# Altium schematic sheet Bluetooth_SOC.SchDoc
size 420 x 297 mm; SheetNumber: 2; SheetTotal: 3
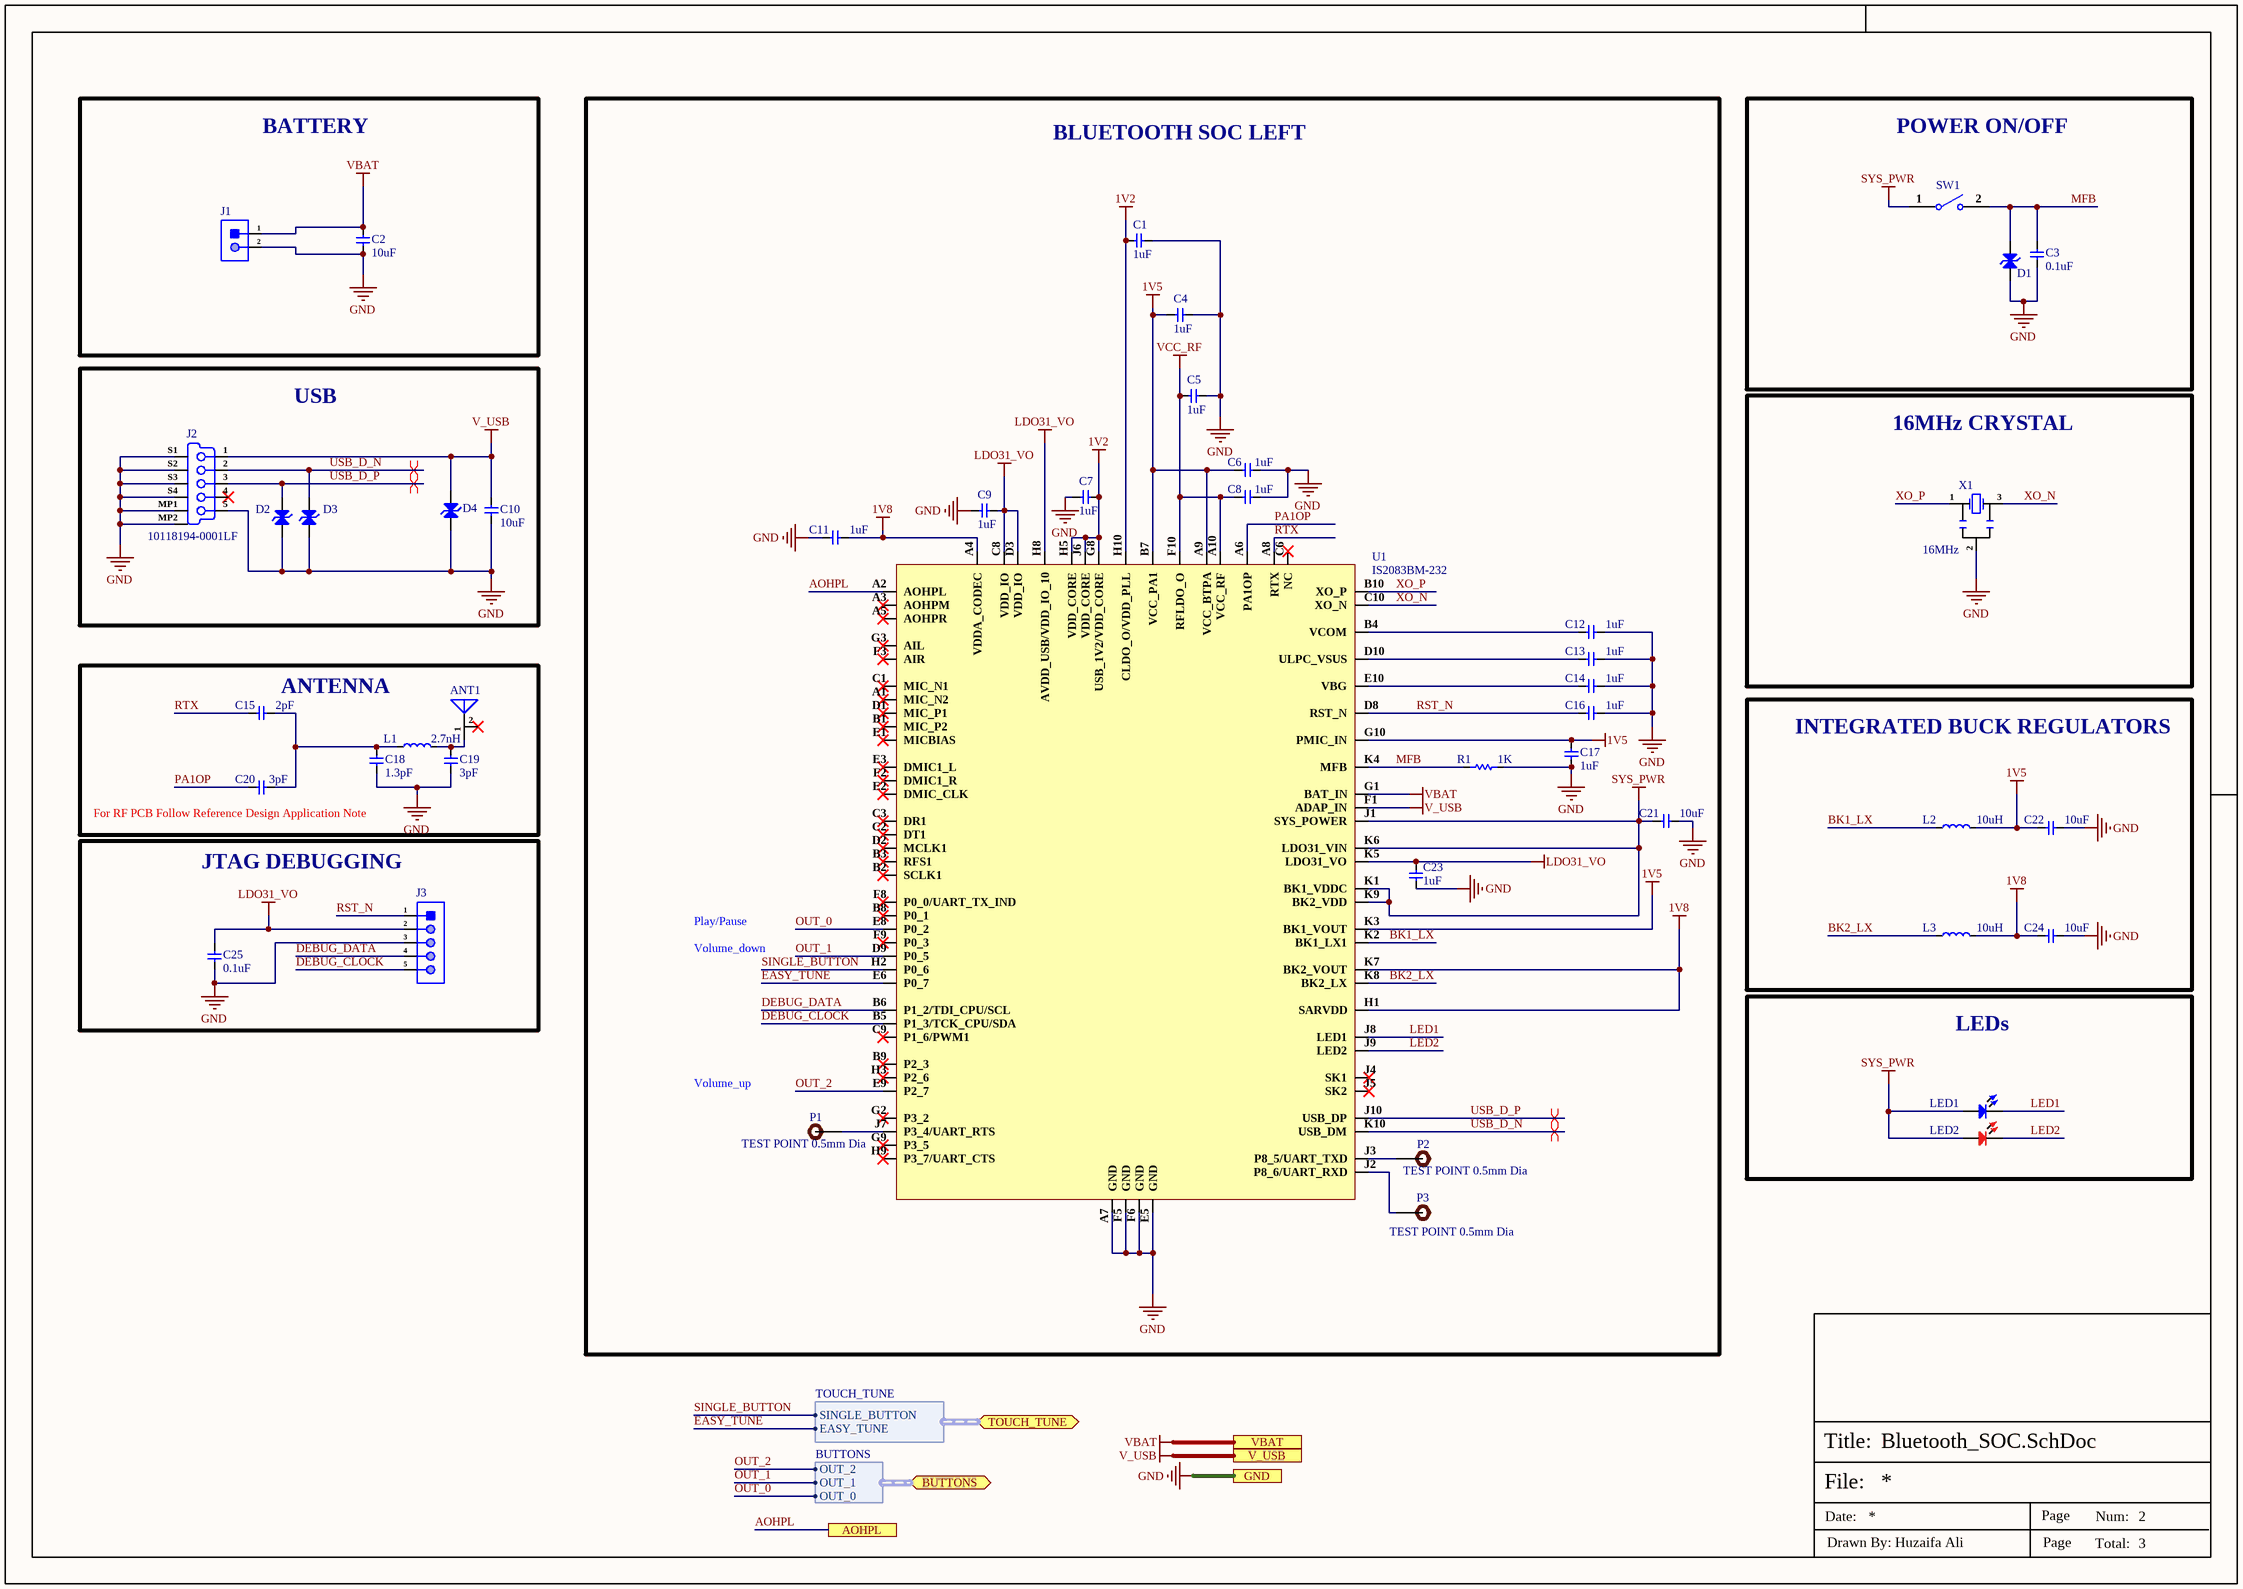
[diagram p0: Bluetooth_SOC.SchDoc]

## Parts
ANT1  ANT3216LL00R2400A  [ANT3216LL00R2400A]  (value not drawn)
C1  1uF  [Cap-0201]
C2  10uF  [Cap-0402]
C3  0.1uF  [CAP-0201]
C4  1uF  [Cap-0201]
C5  1uF  [Cap-0201]
C6  1uF  [Cap-0201]
C7  1uF  [Cap-0201]
C8  1uF  [Cap-0201]
C9  1uF  [Cap-0201]
C10  10uF  [Cap-0402]
C11  1uF  [Cap-0201]
C12  1uF  [Cap-0201]
C13  1uF  [Cap-0201]
C14  1uF  [Cap-0201]
C15  2pF  [CAP-0201]
C16  1uF  [Cap-0201]
C17  1uF  [Cap-0201]
C18  1.3pF  [CAP-0201]
C19  3pF  [CAP-0201]
C20  3pF  [CAP-0201]
C21  10uF  [Cap-0402]
C22  10uF  [Cap-0402]
C23  1uF  [Cap-0201]
C24  10uF  [Cap-0402]
C25  0.1uF  [CAP-0201]
D1  PESD5V0H1BSFYL  [DSN0603-2]  (value not drawn)
D2  PESD5V0H1BSFYL  [DSN0603-2]  (value not drawn)
D3  PESD5V0H1BSFYL  [DSN0603-2]  (value not drawn)
D4  PESD5V0H1BSFYL  [DSN0603-2]  (value not drawn)
J1  2 Test Pad  [2 Test Pad]  (value not drawn)
J2  10118194-0001LF  [10118194-0001LF_]
J3  5 Test Pad  [5 Test Pad]  (value not drawn)
L1  2.7nH  [IND-0201]
L2  10uH  [IND-0603 (1608 Metric)]
L3  10uH  [IND-0603 (1608 Metric)]
LED1  Blue  [LED-0603]  (value not drawn)
LED2  RED  [LED-0603]  (value not drawn)
P1  TEST POINT 0.5mm Dia  [Test-point - 0.5mm]
P2  TEST POINT 0.5mm Dia  [Test-point - 0.5mm]
P3  TEST POINT 0.5mm Dia  [Test-point - 0.5mm]
R1  1K  [Res-0201]
SW1  B3U-1000P  [B3U-1000P]  (value not drawn)
U1  IS2083BM-232  [82-VFBGA]
X1  16MHz  [SMD3213-3P]

## Blocks framed on the sheet
BATTERY: C2 J1
BLUETOOTH SOC LEFT: C1 C4-C9 C11-C14 C16 C17 C21 C23 P1-P3 R1 U1
POWER ON/OFF: C3 D1 SW1
USB: C10 D2-D4 J2
16MHz CRYSTAL: X1
ANTENNA: ANT1 C15 C18-C20 L1
INTEGRATED BUCK REGULATORS: C22 C24 L2 L3
JTAG DEBUGGING: C25 J3
LEDs: LED1 LED2

## Ports
AOHPL, BUTTONS (bidir, harness BUTTONS), GND, TOUCH_TUNE (bidir, harness TOUCH_TUNE), V_USB, VBAT

## Harnesses
BUTTONS: OUT_2, OUT_1, OUT_0
TOUCH_TUNE: SINGLE_BUTTON, EASY_TUNE

## Nets
1V2: C1.1 C7.1 U1.G8(USB_1V2/VDD_CORE) U1.H5(VDD_CORE) U1.H10(CLDO_O/VDD_PLL) U1.J6(VDD_CORE)
1V5: C4.2 C6.2 C17.2 C22.2 L2.2 U1.A9(VCC_BTPA) U1.B7(VCC_PA1) U1.G10(PMIC_IN) U1.K3(BK1_VOUT)
1V8: C11.2 C24.2 L3.2 U1.A4(VDDA_CODEC) U1.H1(SARVDD) U1.K7(BK2_VOUT)
GND: C1.2 C2.2 C3.1 C4.1 C5.1 C6.1 C7.2 C8.1 C9.2 C10.2 C11.1 C12.2 C13.2 C14.2 C16.2 C17.1 C18.1 C19.1 C21.1 C22.1 C23.1 C24.1 C25.1 D1.1(A) D2.1(A) D3.1(A) D4.1(A) J1.2 J2.5(GND) J2.MP1(Tab) J2.MP2(Tab) J2.S1(Shield) J2.S2(Shield) J2.S3(Shield) J2.S4(Shield) J3.3 R1.2 U1.A7(GND) U1.E5(GND) U1.F5(GND) U1.F6(GND) X1.2 ; port GND
LDO31_VO: C9.1 C23.2 C25.2 J3.2 U1.C8(VDD_IO) U1.D3(VDD_IO) U1.H8(AVDD_USB/VDD_IO_10) U1.K5(LDO31_VO)
SYS_PWR: C21.2 LED1.1 LED2.1 SW1.1 U1.J1(SYS_POWER) U1.K1(BK1_VDDC) U1.K6(LDO31_VIN) U1.K9(BK2_VDD)
V_USB: C10.1 D4.2(A) J2.1(V_BUS_(5V)) U1.F1(ADAP_IN) ; port V_USB
VBAT: C2.1 J1.1 U1.G1(BAT_IN) ; port VBAT
VCC_RF: C5.2 C8.2 U1.A10(VCC_RF) U1.F10(RFLDO_O)
AOHPL: U1.A2(AOHPL) ; port AOHPL
BK1_LX: L2.1 U1.K2(BK1_LX1)
BK2_LX: L3.1 U1.K8(BK2_LX)
DEBUG_CLOCK: J3.5 U1.B5(P1_3/TCK_CPU/SDA)
DEBUG_DATA: J3.4 U1.B6(P1_2/TDI_CPU/SCL)
EASY_TUNE: U1.E6(P0_7) ; port TOUCH_TUNE.EASY_TUNE
LED1: LED1.2 U1.J8(LED1)
LED2: LED2.2 U1.J9(LED2)
MFB: C3.2 D1.2(A) R1.1 SW1.2 U1.K4(MFB)
OUT_0: U1.E8(P0_2) ; port BUTTONS.OUT_0
OUT_1: U1.D9(P0_5) ; port BUTTONS.OUT_1
OUT_2: U1.E9(P2_7) ; port BUTTONS.OUT_2
PA1OP: C20.1 U1.A6(PA1OP)
RST_N: C16.1 J3.1 U1.D8(RST_N)
RTX: C15.1 U1.A8(RTX)
SINGLE_BUTTON: U1.H2(P0_6) ; port TOUCH_TUNE.SINGLE_BUTTON
USB_D_N: D3.2(A) J2.2(D-) U1.K10(USB_DM)
USB_D_P: D2.2(A) J2.3(D+) U1.J10(USB_DP)
XO_N: U1.C10(XO_N) X1.3(CRYSTAL)
XO_P: U1.B10(XO_P) X1.1(CRYSTAL)
NetANT1_1: ANT1.1(Feed) C19.2 L1.2
NetC12_1: C12.1 U1.B4(VCOM)
NetC13_1: C13.1 U1.D10(ULPC_VSUS)
NetC14_1: C14.1 U1.E10(VBG)
NetC15_2: C15.2 C18.2 C20.2 L1.1
NetP1_1: P1.1 U1.J7(P3_4/UART_RTS)
NetP2_1: P2.1 U1.J3(P8_5/UART_TXD)
NetP3_1: P3.1 U1.J2(P8_6/UART_RXD)

Not connected (* = marked no-connect by the designer): ANT1 2(NC)*; J2 4(NC)*; U1 A1(MIC_N2)* A3(AOHPM)* A5(AOHPR)* B1(MIC_P2)* B2(SCLK1)* B3(RFS1)* B8(P0_1)* B9(P2_3)* C1(MIC_N1)* C2(DT1)* C3(DR1)* C6(NC)* C9(P1_6/PWM1)* D1(MIC_P1)* D2(MCLK1)* E1(MICBIAS)* E2(DMIC_CLK)* E3(DMIC1_L)* F2(DMIC1_R)* F3(AIR)* F8(P0_0/UART_TX_IND)* F9(P0_3)* G2(P3_2)* G3(AIL)* G9(P3_5)* H3(P2_6)* H9(P3_7/UART_CTS)* J4(SK1)* J5(SK2)*

## Layout directives
differential pair; net class GSM_USB; differential pair class GSM_USB_Lines; rule Impedance Constraint [Min = 85.00    Max = 90.00    ]; rule Matched Net Lengths [Tolerance = 50mil]: USB_D_N, USB_D_P

## Notes on the sheet
- (near C20) For RF PCB Follow Reference Design Application Note
- Play/Pause
- Volume_down
- Volume_up
- File:
- Title:
- Date:
- Page
- Num:
- Total:
- Drawn By: Huzaifa Ali

## Library data of the parts
ANT1 = ANT3216LL00R2400A: 5.05dBi Chip antenna Linear 160MHz 2.45GHz 1W 1206 Antennas ROHS; Manufacturer: YAGEO; ComponentLink1Description: LCSC; ComponentLink1URL: https://www.lcsc.com/product-detail/Antennas_YAGEO-ANT3216LL00R2400A_C293767.html; Manufacturer Part Number: ANT3216LL00R2400A; Package: 1206; LCSC Part Number: C293767; Item Type: Antenna
C1 C4-C9 C11-C14 C16 C17 C23 = CC0201KRX5R5BB105: CAP CER 1UF 6.3V X5R 0201; Manufacturer: Yageo; Tolerance: 10%; Item Type: Capacitor; Supplier 1: Arrow Electronics; Manufacturer Part Number: CC0201KRX5R5BB105; RoHS: Yes; Category: Ceramic Capacitors; Stock 1: 600000; Pricing 1: 15000=0.00740 (USD); Mount: Surface Mount; Case/Package: 0201; Case Code (Imperial): 0201; Case Code (Metric): 0603; Min Operating Temperature: -55°C; Max Operating Temperature: 85°C; Packaging: Cut Tape; Capacitance: 1uF; Voltage Rating: 6.3V; RoHS Compliant: Yes; ComponentLink1URL: http://www.yageo.com/documents/recent/UPY-GPHC_X5R_4V-to-50V_25.pdf?src-supplier=Digi-Key; ComponentLink1Description: http://www.yageo.com/documents/recent/UPY-GPHC_X5R_4V-to-50V_25.pdf?src-supplier=Digi-Key; ComponentLink2URL: https://www.yageo.com/upload/media/product/productsearch/datasheet/mlcc/UPY-GPHC_X5R_4V-to-50V_26.pdf?src-supplier=Digi-Key; ComponentLink2Description: https://www.yageo.com/upload/media/product/productsearch/datasheet/mlcc/UPY-GPHC_X5R_4V-to-50V_26.pdf?src-supplier=Digi-Key; Supplier Part Number 1: CC0201KRX5R5BB105; LCSC Part Number: C541330
C2 C10 C21 C22 C24 = CL05A106MP5NUNC: CAP CER 10UF 10V X5R 0402; Manufacturer: Samsung; Tolerance: 20%; Item Type: Capacitor; Supplier 1: Avnet; Manufacturer Part Number: CL05A106MP5NUNC; RoHS: Yes; Category: Ceramic Capacitors; Stock 1: 1729850; Pricing 1: 10000=0.02537 (USD); Mount: Surface Mount; Case/Package: 0402; Case Code (Metric): 1005; Case Code (Imperial): 0402; Contact Plating: Tin; Min Operating Temperature: -55°C; Max Operating Temperature: 85°C; Package Quantity: 1; Packaging: Tape and Reel; Capacitance: 10uF; Voltage Rating: 10V; Dielectric: X5R; Termination: Wraparound; Series: CL; Construction: Flat; Length: 1mm; Width: 0.02inch; Thickness: 0.028inch; Depth: 0.5mm; Radiation Hardening: No; Lead Free: Lead Free; RoHS Compliant: Yes; ComponentLink1URL: https://datasheet.ciiva.com/25721/cl05a106mp5nunc-25721584.pdf?src-supplier=Digi-Key; ComponentLink1Description: https://datasheet.ciiva.com/25721/cl05a106mp5nunc-25721584.pdf?src-supplier=Digi-Key; ComponentLink2URL: https://datasheet.ciiva.com/26838/getdatasheetpartid-745310-26838170.pdf?src-supplier=Verical; ComponentLink2Description: https://datasheet.ciiva.com/26838/getdatasheetpartid-745310-26838170.pdf?src-supplier=Verical; Supplier Part Number 1: CL05A106MP5NUNC; LCSC Part Number: C315248
C3 C25 = CC0201KRX5R6BB104: CAP CER 0.1UF 10V X5R 0201; Manufacturer: Yageo; Capacitance: 100nF; Tolerance: 10%; Supplier 1: Mouser; Manufacturer Part Number: CC0201KRX5R6BB104; RoHS: Yes; Category: Ceramic Capacitors; Stock 1: 824403; Pricing 1: 1=0.10000, 10=0.02400, 50=0.02400, 100=0.01900, 1000=0.01100, 10000=0.00900 (USD); Mount: Surface Mount; Case/Package: 0201; Case Code (Imperial): 0201; Case Code (Metric): 0603; Weight: 6E-06oz; Min Operating Temperature: -55°C; Max Operating Temperature: 85°C; Dielectric: X5R; Voltage Rating (DC): 10V; Packaging: Tape and Reel; Termination: SMD/SMT; Resistor Type: Ceramic; Voltage Rating: 10V; Series: CC; Construction: Flat; Length: 0.6mm; Width: 0.012inch; Height: 0.3mm; Thickness: 0.013inch; Depth: 0.3mm; Radiation Hardening: No; Lead Free: Lead Free; Halogen Free: Halogen Free; RoHS Compliant: Yes; ComponentLink1URL: https://datasheet.ciiva.com/11587/upy-gphc-x5r-4v-to-50v-12-11587190.pdf?src-supplier=Avnet; ComponentLink1Description: https://datasheet.ciiva.com/11587/upy-gphc-x5r-4v-to-50v-12-11587190.pdf?src-supplier=Avnet; Supplier Part Number 1: 603-CC201KRX5R6BB104; LCSC Part Number: C190183
C15 = GRM0335C1E2R0BA01D: CAP CER 2PF 25V C0G/NP0 0201; Manufacturer: Murata; Item Type: Capacitor; Supplier 1: Arrow Electronics; Manufacturer Part Number: GRM0335C1E2R0BA01D; RoHS: Yes; Category: Ceramic Capacitors; Stock 1: 65754; Pricing 1: 1=0.053, 10=0.0058, 25=0.004, 100=0.0026, 500=0.0024, 1000=0.0023, 3000=0.0022, 6000=0.0021, 15000=0.002, 30000=0.0019 (USD); ComponentLink1URL: https://datasheet.ciiva.com/29535/grm0335c1e2r0ba01-01-29535294.pdf?src-supplier=Digi-Key; ComponentLink1Description: https://datasheet.ciiva.com/29535/grm0335c1e2r0ba01-01-29535294.pdf?src-supplier=Digi-Key; Supplier Part Number 1: GRM0335C1E2R0BA01D; LCSC Part Number: C161383
C18 = GRM0335C1H1R3BA01D: CAP CER 1.3PF 50V C0G/NP0 0201; Manufacturer: Murata; Material: 4241ConductorMaterial; Temperature Coefficient: 30ppm/°C; Item Type: Capacitor; Supplier 1: Arrow Electronics; Manufacturer Part Number: GRM0335C1H1R3BA01D; RoHS: Yes; Category: Ceramic Capacitors; Stock 1: 135000; Pricing 1: 15000=0.0024, 30000=0.0022, 75000=0.0018, 105000=0.0016, 150000=0.0015 (USD); Height: 330um; ComponentLink1URL: https://datasheet.ciiva.com/6270/partnumbering-e-01-6270997.pdf?src-supplier=Digi-Key; ComponentLink1Description: https://datasheet.ciiva.com/6270/partnumbering-e-01-6270997.pdf?src-supplier=Digi-Key; ComponentLink2URL: https://datasheet.ciiva.com/6271/partnumbering-e-01-6271000.pdf?src-supplier=Digi-Key; ComponentLink2Description: https://datasheet.ciiva.com/6271/partnumbering-e-01-6271000.pdf?src-supplier=Digi-Key; ComponentLink3URL: https://datasheet.ciiva.com/6271/partnumbering-e-01-6271002.pdf?src-supplier=Digi-Key; ComponentLink3Description: https://datasheet.ciiva.com/6271/partnumbering-e-01-6271002.pdf?src-supplier=Digi-Key; Supplier Part Number 1: GRM0335C1H1R3BA01D; LCSC Part Number: C237529
C19 C20 = GRM0335C1H3R0BA01D: CAP CER 3PF 50V C0G/NP0 0201; Manufacturer: Murata; Material: 4241ConductorMaterial; Temperature Coefficient: 30ppm/°C; Item Type: Capacitor; Supplier 1: Rs; Manufacturer Part Number: GRM0335C1H3R0BA01D; RoHS: Yes; Category: Ceramic Capacitors; Stock 1: 11000; Pricing 1: 1000=0.004, 5000=0.003, 10000=0.003 (GBP); Height: 330um; ComponentLink1URL: https://datasheet.ciiva.com/29538/partnumbering-e-01-29538501.pdf?src-supplier=Digi-Key; ComponentLink1Description: https://datasheet.ciiva.com/29538/partnumbering-e-01-29538501.pdf?src-supplier=Digi-Key; Supplier Part Number 1: 1851754; LCSC Part Number: C237430
D1-D4 = PESD5V0H1BSFYL: TVS DIODE 5VWM 6.3VC DSN0603-2; Manufacturer: Nexperia; Supplier 1: Avnet; Manufacturer Part Number: PESD5V0H1BSFYL; RoHS: Yes; Category: ESD and Circuit Protection ICs; Stock 1: 9000; Pricing 1: 18000=0.06453, 36000=0.06278, 54000=0.06104, 90000=0.05930, 180000=0.05755, 900000=0.05581, 1800000=0.05406 (USD); RoHS Compliant: Yes; ComponentLink1URL: http://www.farnell.com/datasheets/1961312.pdf?src-supplier=Farnell; ComponentLink1Description: http://www.farnell.com/datasheets/1961312.pdf?src-supplier=Farnell; ComponentLink2URL: https://assets.nexperia.com/documents/data-sheet/PESD5V0H1BSF.pdf?src-supplier=Digi-Key; ComponentLink2Description: https://assets.nexperia.com/documents/data-sheet/PESD5V0H1BSF.pdf?src-supplier=Digi-Key; ComponentLink3URL: http://www.farnell.com/datasheets/1961312.pdf?src-supplier=Newark; ComponentLink3Description: http://www.farnell.com/datasheets/1961312.pdf?src-supplier=Newark; Supplier Part Number 1: PESD5V0H1BSFYL; LCSC Part Number: C477989; Item Type: Diode
J1 = 2 Test Pad: Wire Connecting Pad; Item Type: Test Point; Manufacturer Part Number: 2 Test Pad
J2 = 10118194-0001LF: CONN RCPT USB2.0 MICRO B SMD R/A; Manufacturer: Amphenol FCI; Gender: Receptacle; Current Rating: 1.8A; Connector Type: USB,Receptacle; Number of Contacts: 5; Insulation Resistance: 1GR; Number of Ports: 1; Max Voltage Rating (AC): 100V; Pitch: 0.65mm; Item Type: USB B Connector; Supplier 1: Digi-Key; Manufacturer Part Number: 10118194-0001LF; Stock 1: 35943; Pricing 1: 1=0.43, 10=0.405, 25=0.3648, 50=0.3242, 100=0.3107, 250=0.28368, 500=0.27016 (USD); Mount: Surface Mount,Horizontal; Color: Black; Contact Material: Copper Alloy; Contact Plating: Gold; Number of Terminals: 5; Housing Material: Polymer; Min Operating Temperature: -55°C; Max Operating Temperature: 85°C; Package Quantity: 9600; Packaging: Tape and Reel; Termination: Solder; Orientation: Right Angle; Features: Shielded; Length: 8.05mm; Depth: 5mm; Radiation Hardening: No; Lead Free: Lead Free; Flammability Rating: UL94 V-0; ComponentLink1URL: http://www.amphenol-icc.com/media/wysiwyg/files/drawing/10118194.pdf?src-supplier=Digi-Key; ComponentLink1Description: http://www.amphenol-icc.com/media/wysiwyg/files/drawing/10118194.pdf?src-supplier=Digi-Key; ComponentLink2URL: https://cdn.amphenol-icc.com/media/wysiwyg/files/drawing/10118194.pdf?src-supplier=Mouser; ComponentLink2Description: https://cdn.amphenol-icc.com/media/wysiwyg/files/drawing/10118194.pdf?src-supplier=Mouser; ComponentLink3URL: https://cdn.amphenol-icc.com/media/wysiwyg/files/drawing/10118194.pdf?src-supplier=Verical; ComponentLink3Description: https://cdn.amphenol-icc.com/media/wysiwyg/files/drawing/10118194.pdf?src-supplier=Verical; Supplier Part Number 1: 609-4618-1-ND; LCSC Part Number: C132563
J3 = 5 Test Pad: Wire Connecting Pad; Item Type: Test Point; Manufacturer Part Number: 5 Test Pad
L1 = LQP03TN2N7B02D: FIXED IND 2.7NH 500MA 200MOHM SM; Manufacturer: Murata; Core Material: Non-Magnetic; Self Resonant Frequency: 6GHz; Tolerance: 3%; Shielding: Unshielded; DC Resistance (DCR): 200mR; Q Factor: 14; Current: 350mA; Test Frequency: 500MHz; Item Type: Inductor; Supplier 1: Rs; Manufacturer Part Number: LQP03TN2N7B02D; RoHS: Yes; Category: Fixed Inductors; Stock 1: 4000; Pricing 1: 200=0.007 (GBP); Mount: Surface Mount; Case/Package: 0201; Case Code (Metric): 0603; Case Code (Imperial): 0201; Min Operating Temperature: -55°C; Max Operating Temperature: 125°C; Packaging: Tape and Reel; Package Quantity: 1; Current Rating: 500mA; Inductance: 2.7nH; Max DC Current: 500mA; Termination: SMD/SMT; DC Current: 500mA; Series: LQP03TN_02; Technology: THIN FILM; Length: 0.024inch; Width: 0.012inch; Height: 0.3mm; Height - Seated (Max): 0.013inch; Depth: 0.33mm; Military Standard: Not; Reach SVHC Compliant: No; Lead Free: Lead Free; RoHS Compliant: Yes; ComponentLink1URL: http://www.farnell.com/datasheets/1888743.pdf?src-supplier=Farnell; ComponentLink1Description: http://www.farnell.com/datasheets/1888743.pdf?src-supplier=Farnell; ComponentLink2URL: http://www.mouser.com/ds/2/281/c51e-794816.pdf?src-supplier=Mouser; ComponentLink2Description: http://www.mouser.com/ds/2/281/c51e-794816.pdf?src-supplier=Mouser; ComponentLink3URL: https://media.digikey.com/pdf/Data%20Sheets/Murata%20PDFs/LQP03_Series_Br.pdf?src-supplier=Digi-Key; ComponentLink3Description: https://media.digikey.com/pdf/Data%20Sheets/Murata%20PDFs/LQP03_Series_Br.pdf?src-supplier=Digi-Key; ComponentLink4URL: http://components.arrow.com/part/dataview/49670632S8721729N2606?src-supplier=Arrow+Electronics; ComponentLink4Description: http://components.arrow.com/part/dataview/49670632S8721729N2606?src-supplier=Arrow+Electronics; ComponentLink5URL: https://datasheet.octopart.com/LQP03TN2N7B02D-Murata-datasheet-26765549.pdf?src-supplier=Future+Electronics; ComponentLink5Description: https://datasheet.octopart.com/LQP03TN2N7B02D-Murata-datasheet-26765549.pdf?src-supplier=Future+Electronics; ComponentLink6URL: http://psearch.en.murata.com/inductor/product/LQP03TN2N7B02%23.pdf?src-supplier=Avnet; ComponentLink6Description: http://psearch.en.murata.com/inductor/product/LQP03TN2N7B02%23.pdf?src-supplier=Avnet; ComponentLink7URL: http://search.murata.co.jp/Ceramy/image/img/w_hinm/S0084E.pdf?src-supplier=Digi-Key; ComponentLink7Description: http://search.murata.co.jp/Ceramy/image/img/w_hinm/S0084E.pdf?src-supplier=Digi-Key; ComponentLink8URL: http://www.farnell.com/datasheets/1888743.pdf?src-supplier=Newark; ComponentLink8Description: http://www.farnell.com/datasheets/1888743.pdf?src-supplier=Newark; ComponentLink9URL: http://www.farnell.com/datasheets/1888743.pdf?src-supplier=Element14; ComponentLink9Description: http://www.farnell.com/datasheets/1888743.pdf?src-supplier=Element14; ComponentLink10URL: https://datasheet.octopart.com/LQP03TN2N7B02D-Murata-datasheet-141404629.pdf?src-supplier=TME; ComponentLink10Description: https://datasheet.octopart.com/LQP03TN2N7B02D-Murata-datasheet-141404629.pdf?src-supplier=TME; Supplier Part Number 1: 1065349; LCSC Part Number: C98043
L2 L3 = LQM18FN100M00D: FIXED IND 10UH 50MA 1.17 OHM SMD; Manufacturer: Murata; Core Material: Ferrite; Self Resonant Frequency: 30MHz; Shielding: Shielded; Tolerance: 20%; DC Resistance (DCR): 1.17R; Test Frequency: 1MHz; Item Type: Inductor; Supplier: Rs; Supplier Part Number: 7242696; Manufacturer Part Number: LQM18FN100M00D; RoHS: Yes; Category: Fixed Inductors; Stock: 525; Pricing: 25=0.11, 50=0.093, 500=0.082, 1000=0.071, 2500=0.066 (GBP); Mounting Technology: Surface Mount; Case/Package: 0603; Case Code (Metric): 1608; Case Code (Imperial): 0603; Min Operating Temperature: -55°C; Max Operating Temperature: 125°C; Packaging: Tape and Reel; Package Quantity: 4000; Current Rating: 50mA; Value: 10uH; Saturation Current: 50mA; Max DC Current: 50mA; Termination: SMD/SMT; DC Current: 50mA; Series: LQM18F; Length: 0.063inch; Width: 0.031inch; Height: 0.9mm; Height - Seated (Max): 0.035inch; Depth: 0.9mm; Military Standard: Not; Lead Free: Lead Free; RoHS Compliant: Yes; ComponentLink1URL: https://datasheet.ciiva.com/11799/0900766b80f15512-11799471.pdf?src-supplier=Rs; ComponentLink1Description: https://datasheet.ciiva.com/11799/0900766b80f15512-11799471.pdf?src-supplier=Rs; ComponentLink2URL: https://datasheet.ciiva.com/3865/286lqm18fn100m0023-3865365.pdf?src-supplier=Arrow+Electronics; ComponentLink2Description: https://datasheet.ciiva.com/3865/286lqm18fn100m0023-3865365.pdf?src-supplier=Arrow+Electronics; ComponentLink3URL: https://datasheet.ciiva.com/1039/l0075s0097lqm18f-1039418.pdf?src-supplier=Digi-Key; ComponentLink3Description: https://datasheet.ciiva.com/1039/l0075s0097lqm18f-1039418.pdf?src-supplier=Digi-Key; ComponentLink4URL: https://datasheet.ciiva.com/1039/l0075s0097lqm18f-1039417.pdf?src-supplier=Digi-Key; ComponentLink4Description: https://datasheet.ciiva.com/1039/l0075s0097lqm18f-1039417.pdf?src-supplier=Digi-Key; ComponentLink5URL: https://datasheet.ciiva.com/1039/l0075s0097lqm18f-1039419.pdf?src-supplier=Digi-Key; ComponentLink5Description: https://datasheet.ciiva.com/1039/l0075s0097lqm18f-1039419.pdf?src-supplier=Digi-Key; ComponentLink6URL: https://datasheet.ciiva.com/8510/l0075s0097lqm18f-8510087.pdf?src-supplier=Avnet; ComponentLink6Description: https://datasheet.ciiva.com/8510/l0075s0097lqm18f-8510087.pdf?src-supplier=Avnet; LCSC Part Number: C86083
LED1 = NCD0603B3: blue 0603 Light Emitting Diodes (LED) ROHS; Manufacturer: Foshan NationStar Optoelectronics; Manufacturer Part Number: NCD0603B3; Package: 0603; LCSC Part Number: C158101; Item Type: LED; ComponentLink1Description: LCSC; ComponentLink1URL: https://www.lcsc.com/product-detail/Light-Emitting-Diodes-LED_Foshan-NationStar-Optoelectronics-NCD0603B3_C158101.html
LED2 = NCD0603R3: RED LED 0603 Light Emitting Diodes; Manufacturer: Foshan NationStar Optoelectronics; Manufacturer Part Number: NCD0603R3; Package: 0603; Item Type: LED; LCSC Part Number: C3151730; ComponentLink1Description: LCSC; ComponentLink1URL: https://www.lcsc.com/product-detail/Light-Emitting-Diodes-LED_Foshan-NationStar-Optoelectronics-NCD0603R3_C3151730.html
P1-P3 = TEST POINT 0.5mm Dia: Test Point ON; Item Type: Test Point
R1 = RC0201FR-071KP: RES 1K OHM 1% 1/20W 0201; Manufacturer: Yageo; Supplier 1: Digi-Key; Manufacturer Part Number: RC0201FR-071KP; RoHS: Yes; Stock 1: 4800; Pricing 1: 1=0.11000, 10=0.10200, 100=0.03940, 1000=0.01734, 2500=0.01497, 5000=0.01340 (USD); RoHS Compliant: Yes; Supplier Part Number 1: 13-RC0201FR-071KPCT-ND; LCSC Part Number: C3953443
SW1 = B3U-1000P: SWITCH TACTILE SPST-NO 0.05A 12V; Manufacturer: Omron; Mechanical Life: 200000Cycles; Operating Force: 1.5N; Throw Configuration: SPST; Current Rating: 50mA; Contact Resistance: 100mR; Illumination Type: Non-Illuminated,Illuminated; Switch Travel: 0.15mm; Switch Function: Off-Mom; Actuator Type: Standard; Actuator Length: 0.4mm; Ratings: Dust Proof,IP40; ComponentLink1URL: http://www.farnell.com/datasheets/60838.pdf?src-supplier=Farnell; ComponentLink1Description: http://www.farnell.com/datasheets/60838.pdf?src-supplier=Farnell; ComponentLink2URL: http://www.farnell.com/datasheets/60838.pdf?src-supplier=Element14; ComponentLink2Description: http://www.farnell.com/datasheets/60838.pdf?src-supplier=Element14; ComponentLink3URL: https://omronfs.omron.com/en_US/ecb/products/pdf/en-b3u.pdf?src-supplier=Digi-Key; ComponentLink3Description: https://omronfs.omron.com/en_US/ecb/products/pdf/en-b3u.pdf?src-supplier=Digi-Key; ComponentLink4URL: http://www.omron.com/ecb/products/pdf/en-b3u.pdf?src-supplier=Digi-Key; ComponentLink4Description: http://www.omron.com/ecb/products/pdf/en-b3u.pdf?src-supplier=Digi-Key; ComponentLink5URL: https://www.distrelec.biz/Web/Downloads/he/et/B3U_eng_datasheet.pdf?mime=application%2Fpdf&src-supplier=Distrelec; ComponentLink5Description: https://www.distrelec.biz/Web/Downloads/he/et/B3U_eng_datasheet.pdf?mime=application%2Fpdf&src-supplier=Distrelec; ComponentLink6URL: http://www.onlinecomponents.com/productFiles/mf-OM/en-b3u.pdf?src-supplier=Onlinecomponents.com; ComponentLink6Description: http://www.onlinecomponents.com/productFiles/mf-OM/en-b3u.pdf?src-supplier=Onlinecomponents.com; Supplier 1: Digi-Key; Manufacturer Part Number: B3U-1000P; Stock 1: 116454; Pricing 1: 1=1, 10=0.961, 25=0.9064, 50=0.7976, 100=0.7251, 250=0.68888, 500=0.67074, 1000=0.52571 (USD); Mount: Surface Mount; Weight: 0.000776oz; Contact Material: Silver; Min Operating Temperature: -25°C; Max Operating Temperature: 70°C; Packaging: Tape and Reel; Voltage Rating (DC): 12V; Package Quantity: 1; Max Current Rating: 50mA; Termination: SMD/SMT; Orientation: Straight; Max Voltage Rating (DC): 12V; Electrical Life: 200000Cycles; Insulation Resistance: 100MR; Contact Current Rating: 50mA; Length: 4mm; Height: 1.2mm; Depth: 2.5mm; Width: 3mm; REACH SVHC: Unknown; Lead Free: Lead Free; ComponentLink7URL: https://www.verical.com/server-webapp/html/getDatasheet?partID=552554&src-supplier=Verical; ComponentLink7Description: https://www.verical.com/server-webapp/html/getDatasheet?partID=552554&src-supplier=Verical; ComponentLink8URL: http://www.farnell.com/datasheets/1685550.pdf?src-supplier=Element14; ComponentLink8Description: http://www.farnell.com/datasheets/1685550.pdf?src-supplier=Element14; ComponentLink9URL: http://www.farnell.com/datasheets/2610940.pdf?src-supplier=Farnell; ComponentLink9Description: http://www.farnell.com/datasheets/2610940.pdf?src-supplier=Farnell; ComponentLink10URL: https://www.alliedelec.com/m/d/4c8a9ef82804fc3c241a13c1e298fd73.pdf?src-supplier=Allied+Electronics; ComponentLink10Description: https://www.alliedelec.com/m/d/4c8a9ef82804fc3c241a13c1e298fd73.pdf?src-supplier=Allied+Electronics; Supplier Part Number 1: SW1020DKR-ND; LCSC Part Number: C231329; Item Type: Switch
U1 = IS2083BM-232: RF TXRX MODULE BLUETOOTH SMD; Manufacturer: Microchip Technology; Item Type: IC; Manufacturer Part Number: IS2083BM-232; Package: 82-VFBGA
X1 = CSTCE16M0V53-R0: 16MHz 15pF ±0.5%; Manufacturer: Murata; Impedance: 40R; Frequency Stability: 0.3%; Item Type: Cystal; Supplier 1: Farnell; Manufacturer Part Number: CSTCE16M0V53-R0; RoHS: Yes; Category: Capacitors; Pricing 1: 5=0.34500, 50=0.26100, 250=0.23600, 500=0.19400, 1500=0.18300, 3000=0.17100, 15000=0.16800 (GBP); Case/Package: SMD/SMT; Number of Pins: 3; Contact Plating: Gold; Weight: 0.001023oz; Min Operating Temperature: -20°C; Max Operating Temperature: 80°C; Frequency: 16MHz; Frequency Tolerance: 0.5%; Self Resonant Frequency: 16MHz; Load Capacitance: 15pF; Tolerance: 0.5%; Package Quantity: 3000; Capacitance: 15pF; Packaging: Tape and Reel; Termination: SMD/SMT; Resistor Type: Ceramic; Series: CERALOCK® CSTCE; Length: 3.2mm; Width: 1.3mm; Height: 0.9mm; Reach SVHC Compliant: Yes; Lead Free: Lead Free; RoHS Compliant: Yes; ComponentLink1URL: https://datasheet.ciiva.com/18183/getdatasheetpartid-152969-18183272.pdf?src-supplier=Verical; ComponentLink1Description: https://datasheet.ciiva.com/18183/getdatasheetpartid-152969-18183272.pdf?src-supplier=Verical; ComponentLink2URL: https://datasheet.ciiva.com/1361/1506176-1361293.pdf?src-supplier=Element14; ComponentLink2Description: https://datasheet.ciiva.com/1361/1506176-1361293.pdf?src-supplier=Element14; ComponentLink3URL: https://datasheet.ciiva.com/14132/ceralock-eng-bro-14132735.pdf?src-supplier=Distrelec; ComponentLink3Description: https://datasheet.ciiva.com/14132/ceralock-eng-bro-14132735.pdf?src-supplier=Distrelec; ComponentLink4URL: https://datasheet.ciiva.com/884/p16e-884478.pdf?src-supplier=Digi-Key; ComponentLink4Description: https://datasheet.ciiva.com/884/p16e-884478.pdf?src-supplier=Digi-Key; ComponentLink5URL: https://datasheet.ciiva.com/884/p16e-884477.pdf?src-supplier=Digi-Key; ComponentLink5Description: https://datasheet.ciiva.com/884/p16e-884477.pdf?src-supplier=Digi-Key; ComponentLink6URL: https://datasheet.ciiva.com/884/p16e-884479.pdf?src-supplier=Digi-Key; ComponentLink6Description: https://datasheet.ciiva.com/884/p16e-884479.pdf?src-supplier=Digi-Key; ComponentLink7URL: https://datasheet.ciiva.com/16216/l0430e-16216847.pdf?src-supplier=Future+Electronics; ComponentLink7Description: https://datasheet.ciiva.com/16216/l0430e-16216847.pdf?src-supplier=Future+Electronics; Supplier Part Number 1: 2443265; LCSC Part Number: C32180